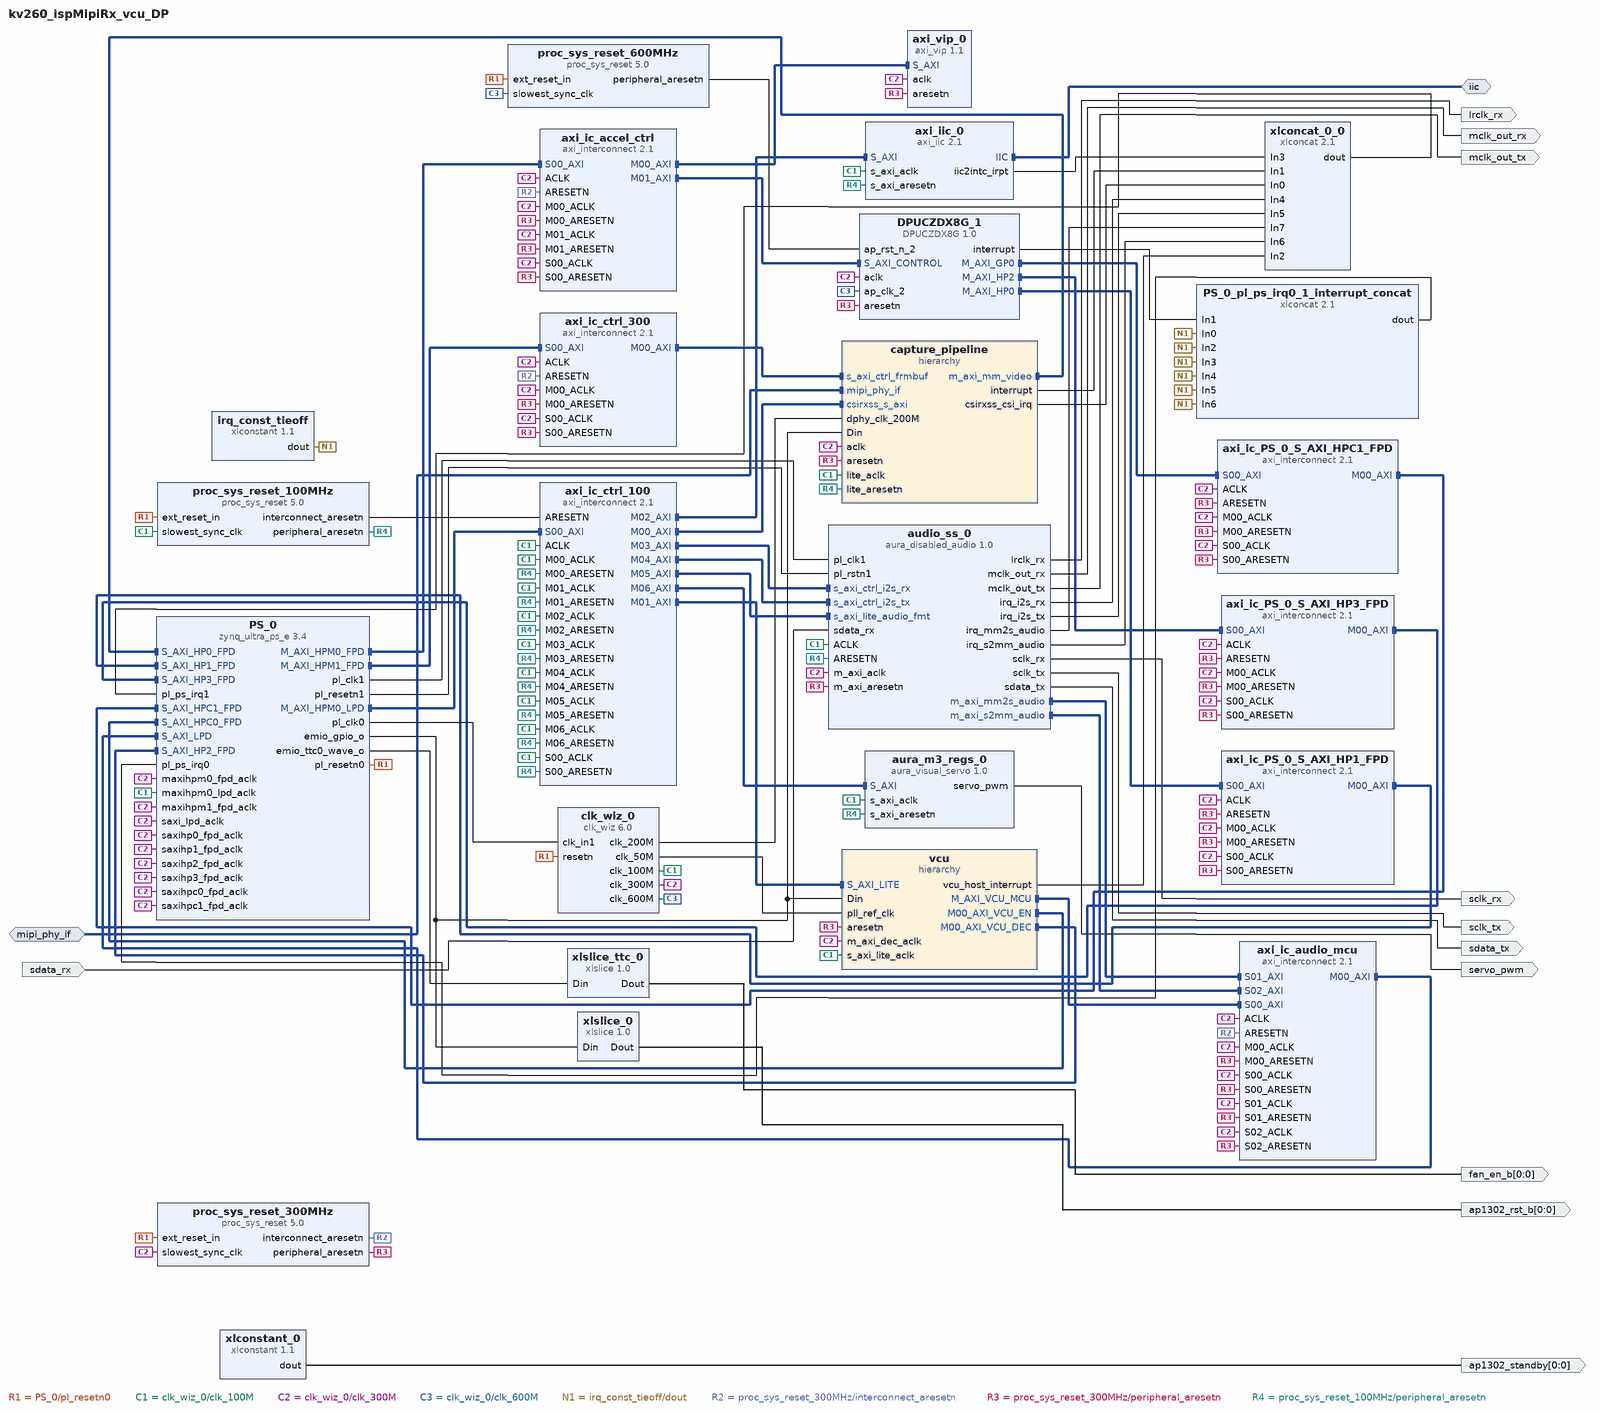
[diagram p0: block diagram of the top level]
# Vivado block design kv260_ispMipiRx_vcu_DP, xck26-sfvc784-2LV-c, Vivado 2022.2
create_bd_design kv260_ispMipiRx_vcu_DP

create_bd_intf_port -mode Master -vlnv xilinx.com:interface:iic_rtl:1.0 iic
create_bd_intf_port -mode Slave -vlnv xilinx.com:interface:mipi_phy_rtl:1.0 mipi_phy_if
create_bd_port -dir O -from 0 -to 0 ap1302_rst_b
create_bd_port -dir O -from 0 -to 0 ap1302_standby
create_bd_port -dir O -from 0 -to 0 fan_en_b
create_bd_port -dir O lrclk_rx
create_bd_port -dir O -type clk mclk_out_rx
create_bd_port -dir O -type clk mclk_out_tx
create_bd_port -dir O sclk_rx
create_bd_port -dir O sclk_tx
create_bd_port -dir I sdata_rx
create_bd_port -dir O sdata_tx
create_bd_port -dir O servo_pwm

create_bd_cell -type ip -vlnv xilinx.com:RTLKernel:DPUCZDX8G:1.0 DPUCZDX8G_1
create_bd_cell -type ip -vlnv xilinx.com:ip:zynq_ultra_ps_e:3.4 PS_0
set_property -dict [list \
  CONFIG.CAN0_BOARD_INTERFACE custom \
  CONFIG.CAN1_BOARD_INTERFACE custom \
  CONFIG.CSU_BOARD_INTERFACE custom \
  CONFIG.DP_BOARD_INTERFACE custom \
  CONFIG.GEM0_BOARD_INTERFACE custom \
  CONFIG.GEM1_BOARD_INTERFACE custom \
  CONFIG.GEM2_BOARD_INTERFACE custom \
  CONFIG.GEM3_BOARD_INTERFACE custom \
  CONFIG.GPIO_BOARD_INTERFACE custom \
  CONFIG.IIC0_BOARD_INTERFACE custom \
  CONFIG.IIC1_BOARD_INTERFACE custom \
  CONFIG.NAND_BOARD_INTERFACE custom \
  CONFIG.PCIE_BOARD_INTERFACE custom \
  CONFIG.PJTAG_BOARD_INTERFACE custom \
  CONFIG.PMU_BOARD_INTERFACE custom \
  CONFIG.PSU_BANK_0_IO_STANDARD LVCMOS18 \
  CONFIG.PSU_BANK_1_IO_STANDARD LVCMOS18 \
  CONFIG.PSU_BANK_2_IO_STANDARD LVCMOS18 \
  CONFIG.PSU_BANK_3_IO_STANDARD LVCMOS18 \
  CONFIG.PSU_USB3__DUAL_CLOCK_ENABLE 1 \
  CONFIG.PSU__CAN1__PERIPHERAL__ENABLE 0 \
  CONFIG.PSU__CRF_APB__ACPU_CTRL__FREQMHZ 1333.333 \
  CONFIG.PSU__CRF_APB__ACPU_CTRL__SRCSEL APLL \
  CONFIG.PSU__CRF_APB__APLL_CTRL__SRCSEL PSS_REF_CLK \
  CONFIG.PSU__CRF_APB__APLL_FRAC_CFG__ENABLED 1 \
  CONFIG.PSU__CRF_APB__DBG_FPD_CTRL__FREQMHZ 250 \
  CONFIG.PSU__CRF_APB__DBG_FPD_CTRL__SRCSEL IOPLL \
  CONFIG.PSU__CRF_APB__DBG_TRACE_CTRL__FREQMHZ 250 \
  CONFIG.PSU__CRF_APB__DBG_TRACE_CTRL__SRCSEL IOPLL \
  CONFIG.PSU__CRF_APB__DBG_TSTMP_CTRL__FREQMHZ 250 \
  CONFIG.PSU__CRF_APB__DBG_TSTMP_CTRL__SRCSEL IOPLL \
  CONFIG.PSU__CRF_APB__DDR_CTRL__FREQMHZ 1200 \
  CONFIG.PSU__CRF_APB__DDR_CTRL__SRCSEL DPLL \
  CONFIG.PSU__CRF_APB__DPDMA_REF_CTRL__FREQMHZ 600 \
  CONFIG.PSU__CRF_APB__DPDMA_REF_CTRL__SRCSEL APLL \
  CONFIG.PSU__CRF_APB__DPLL_CTRL__SRCSEL PSS_REF_CLK \
  CONFIG.PSU__CRF_APB__DP_AUDIO_REF_CTRL__SRCSEL RPLL \
  CONFIG.PSU__CRF_APB__DP_STC_REF_CTRL__SRCSEL RPLL \
  CONFIG.PSU__CRF_APB__DP_VIDEO_REF_CTRL__SRCSEL VPLL \
  CONFIG.PSU__CRF_APB__GDMA_REF_CTRL__FREQMHZ 600 \
  CONFIG.PSU__CRF_APB__GDMA_REF_CTRL__SRCSEL DPLL \
  CONFIG.PSU__CRF_APB__GPU_REF_CTRL__FREQMHZ 600 \
  CONFIG.PSU__CRF_APB__GPU_REF_CTRL__SRCSEL IOPLL \
  CONFIG.PSU__CRF_APB__TOPSW_LSBUS_CTRL__FREQMHZ 100 \
  CONFIG.PSU__CRF_APB__TOPSW_LSBUS_CTRL__SRCSEL IOPLL \
  CONFIG.PSU__CRF_APB__TOPSW_MAIN_CTRL__FREQMHZ 533.33 \
  CONFIG.PSU__CRF_APB__TOPSW_MAIN_CTRL__SRCSEL DPLL \
  CONFIG.PSU__CRF_APB__VPLL_CTRL__SRCSEL PSS_REF_CLK \
  CONFIG.PSU__CRL_APB__ADMA_REF_CTRL__FREQMHZ 500 \
  CONFIG.PSU__CRL_APB__ADMA_REF_CTRL__SRCSEL IOPLL \
  CONFIG.PSU__CRL_APB__CAN1_REF_CTRL__FREQMHZ 100 \
  CONFIG.PSU__CRL_APB__CAN1_REF_CTRL__SRCSEL IOPLL \
  CONFIG.PSU__CRL_APB__CPU_R5_CTRL__FREQMHZ 533.333 \
  CONFIG.PSU__CRL_APB__CPU_R5_CTRL__SRCSEL RPLL \
  CONFIG.PSU__CRL_APB__DBG_LPD_CTRL__FREQMHZ 250 \
  CONFIG.PSU__CRL_APB__DBG_LPD_CTRL__SRCSEL IOPLL \
  CONFIG.PSU__CRL_APB__GEM3_REF_CTRL__FREQMHZ 125 \
  CONFIG.PSU__CRL_APB__GEM3_REF_CTRL__SRCSEL IOPLL \
  CONFIG.PSU__CRL_APB__I2C0_REF_CTRL__FREQMHZ 100 \
  CONFIG.PSU__CRL_APB__I2C0_REF_CTRL__SRCSEL IOPLL \
  CONFIG.PSU__CRL_APB__I2C1_REF_CTRL__FREQMHZ 100 \
  CONFIG.PSU__CRL_APB__I2C1_REF_CTRL__SRCSEL IOPLL \
  CONFIG.PSU__CRL_APB__IOPLL_CTRL__SRCSEL PSS_REF_CLK \
  CONFIG.PSU__CRL_APB__IOU_SWITCH_CTRL__FREQMHZ 250 \
  CONFIG.PSU__CRL_APB__IOU_SWITCH_CTRL__SRCSEL IOPLL \
  CONFIG.PSU__CRL_APB__LPD_LSBUS_CTRL__FREQMHZ 100 \
  CONFIG.PSU__CRL_APB__LPD_LSBUS_CTRL__SRCSEL IOPLL \
  CONFIG.PSU__CRL_APB__LPD_SWITCH_CTRL__FREQMHZ 500 \
  CONFIG.PSU__CRL_APB__LPD_SWITCH_CTRL__SRCSEL IOPLL \
  CONFIG.PSU__CRL_APB__PCAP_CTRL__FREQMHZ 200 \
  CONFIG.PSU__CRL_APB__PCAP_CTRL__SRCSEL IOPLL \
  CONFIG.PSU__CRL_APB__PL0_REF_CTRL__FREQMHZ 100 \
  CONFIG.PSU__CRL_APB__PL0_REF_CTRL__SRCSEL IOPLL \
  CONFIG.PSU__CRL_APB__PL1_REF_CTRL__SRCSEL IOPLL \
  CONFIG.PSU__CRL_APB__QSPI_REF_CTRL__FREQMHZ 125 \
  CONFIG.PSU__CRL_APB__QSPI_REF_CTRL__SRCSEL IOPLL \
  CONFIG.PSU__CRL_APB__RPLL_CTRL__SRCSEL PSS_REF_CLK \
  CONFIG.PSU__CRL_APB__SDIO1_REF_CTRL__FREQMHZ 200 \
  CONFIG.PSU__CRL_APB__SDIO1_REF_CTRL__SRCSEL IOPLL \
  CONFIG.PSU__CRL_APB__SPI1_REF_CTRL__SRCSEL IOPLL \
  CONFIG.PSU__CRL_APB__TIMESTAMP_REF_CTRL__FREQMHZ 100 \
  CONFIG.PSU__CRL_APB__TIMESTAMP_REF_CTRL__SRCSEL IOPLL \
  CONFIG.PSU__CRL_APB__UART0_REF_CTRL__FREQMHZ 100 \
  CONFIG.PSU__CRL_APB__UART0_REF_CTRL__SRCSEL IOPLL \
  CONFIG.PSU__CRL_APB__UART1_REF_CTRL__FREQMHZ 100 \
  CONFIG.PSU__CRL_APB__UART1_REF_CTRL__SRCSEL IOPLL \
  CONFIG.PSU__CRL_APB__USB0_BUS_REF_CTRL__FREQMHZ 250 \
  CONFIG.PSU__CRL_APB__USB0_BUS_REF_CTRL__SRCSEL IOPLL \
  CONFIG.PSU__CRL_APB__USB3_DUAL_REF_CTRL__FREQMHZ 20 \
  CONFIG.PSU__CRL_APB__USB3_DUAL_REF_CTRL__SRCSEL IOPLL \
  CONFIG.PSU__CRL_APB__USB3__ENABLE 1 \
  CONFIG.PSU__CSUPMU__PERIPHERAL__VALID 1 \
  CONFIG.PSU__DDRC__BUS_WIDTH {64 Bit} \
  CONFIG.PSU__DDRC__COMPONENTS Components \
  CONFIG.PSU__DDRC__DEVICE_CAPACITY {8192 MBits} \
  CONFIG.PSU__DDRC__DRAM_WIDTH {16 Bits} \
  CONFIG.PSU__DDRC__ECC Disabled \
  CONFIG.PSU__DDRC__MEMORY_TYPE {DDR 4} \
  CONFIG.PSU__DDRC__SPEED_BIN DDR4_2400R \
  CONFIG.PSU__DDR_HIGH_ADDRESS_GUI_ENABLE 1 \
  CONFIG.PSU__DDR__INTERFACE__FREQMHZ 600.000 \
  CONFIG.PSU__DEVICE_TYPE EV \
  CONFIG.PSU__DISPLAYPORT__LANE0__ENABLE 1 \
  CONFIG.PSU__DISPLAYPORT__LANE0__IO {GT Lane1} \
  CONFIG.PSU__DISPLAYPORT__LANE1__ENABLE 1 \
  CONFIG.PSU__DISPLAYPORT__LANE1__IO {GT Lane0} \
  CONFIG.PSU__DISPLAYPORT__PERIPHERAL__ENABLE 1 \
  CONFIG.PSU__DLL__ISUSED 1 \
  CONFIG.PSU__DPAUX__PERIPHERAL__ENABLE 1 \
  CONFIG.PSU__DPAUX__PERIPHERAL__IO {MIO 27 .. 30} \
  CONFIG.PSU__DP__LANE_SEL {Dual Lower} \
  CONFIG.PSU__DP__REF_CLK_FREQ 27 \
  CONFIG.PSU__DP__REF_CLK_SEL {Ref Clk0} \
  CONFIG.PSU__ENET3__FIFO__ENABLE 0 \
  CONFIG.PSU__ENET3__GRP_MDIO__ENABLE 1 \
  CONFIG.PSU__ENET3__GRP_MDIO__IO {MIO 76 .. 77} \
  CONFIG.PSU__ENET3__PERIPHERAL__ENABLE 1 \
  CONFIG.PSU__ENET3__PERIPHERAL__IO {MIO 64 .. 75} \
  CONFIG.PSU__ENET3__PTP__ENABLE 0 \
  CONFIG.PSU__ENET3__TSU__ENABLE 0 \
  CONFIG.PSU__FPGA_PL0_ENABLE 1 \
  CONFIG.PSU__FPGA_PL1_ENABLE 1 \
  CONFIG.PSU__GEM3_COHERENCY 0 \
  CONFIG.PSU__GEM3_ROUTE_THROUGH_FPD 0 \
  CONFIG.PSU__GEM__TSU__ENABLE 0 \
  CONFIG.PSU__GPIO0_MIO__IO {MIO 0 .. 25} \
  CONFIG.PSU__GPIO0_MIO__PERIPHERAL__ENABLE 1 \
  CONFIG.PSU__GPIO1_MIO__IO {MIO 26 .. 51} \
  CONFIG.PSU__GPIO1_MIO__PERIPHERAL__ENABLE 1 \
  CONFIG.PSU__GPIO_EMIO_WIDTH 92 \
  CONFIG.PSU__GPIO_EMIO__PERIPHERAL__ENABLE 1 \
  CONFIG.PSU__GPIO_EMIO__PERIPHERAL__IO 92 \
  CONFIG.PSU__GPIO_EMIO__WIDTH {[93:0]} \
  CONFIG.PSU__GT__LINK_SPEED HBR \
  CONFIG.PSU__GT__PRE_EMPH_LVL_4 0 \
  CONFIG.PSU__GT__VLT_SWNG_LVL_4 0 \
  CONFIG.PSU__I2C0__PERIPHERAL__ENABLE 0 \
  CONFIG.PSU__I2C1__PERIPHERAL__ENABLE 1 \
  CONFIG.PSU__I2C1__PERIPHERAL__IO {MIO 24 .. 25} \
  CONFIG.PSU__IOU_SLCR__IOU_TTC_APB_CLK__TTC0_SEL APB \
  CONFIG.PSU__IOU_SLCR__IOU_TTC_APB_CLK__TTC1_SEL APB \
  CONFIG.PSU__IOU_SLCR__IOU_TTC_APB_CLK__TTC2_SEL APB \
  CONFIG.PSU__IOU_SLCR__IOU_TTC_APB_CLK__TTC3_SEL APB \
  CONFIG.PSU__MAXIGP0__DATA_WIDTH 32 \
  CONFIG.PSU__MAXIGP1__DATA_WIDTH 32 \
  CONFIG.PSU__NUM_FABRIC_RESETS 2 \
  CONFIG.PSU__OVERRIDE_HPX_QOS 0 \
  CONFIG.PSU__OVERRIDE__BASIC_CLOCK 0 \
  CONFIG.PSU__PMU_COHERENCY 0 \
  CONFIG.PSU__PMU__AIBACK__ENABLE 0 \
  CONFIG.PSU__PMU__EMIO_GPI__ENABLE 0 \
  CONFIG.PSU__PMU__EMIO_GPO__ENABLE 0 \
  CONFIG.PSU__PMU__GPI0__ENABLE 1 \
  CONFIG.PSU__PMU__GPI0__IO {MIO 26} \
  CONFIG.PSU__PMU__GPI1__ENABLE 0 \
  CONFIG.PSU__PMU__GPI2__ENABLE 0 \
  CONFIG.PSU__PMU__GPI3__ENABLE 0 \
  CONFIG.PSU__PMU__GPI4__ENABLE 0 \
  CONFIG.PSU__PMU__GPI5__ENABLE 1 \
  CONFIG.PSU__PMU__GPI5__IO {MIO 31} \
  CONFIG.PSU__PMU__GPO0__ENABLE 0 \
  CONFIG.PSU__PMU__GPO1__ENABLE 0 \
  CONFIG.PSU__PMU__GPO2__ENABLE 0 \
  CONFIG.PSU__PMU__GPO3__ENABLE 1 \
  CONFIG.PSU__PMU__GPO3__IO {MIO 35} \
  CONFIG.PSU__PMU__GPO3__POLARITY low \
  CONFIG.PSU__PMU__GPO4__ENABLE 0 \
  CONFIG.PSU__PMU__GPO5__ENABLE 0 \
  CONFIG.PSU__PMU__PERIPHERAL__ENABLE 1 \
  CONFIG.PSU__PMU__PLERROR__ENABLE 0 \
  CONFIG.PSU__PRESET_APPLIED 1 \
  CONFIG.PSU__PSS_REF_CLK__FREQMHZ 33.333 \
  CONFIG.PSU__QSPI_COHERENCY 0 \
  CONFIG.PSU__QSPI_ROUTE_THROUGH_FPD 0 \
  CONFIG.PSU__QSPI__GRP_FBCLK__ENABLE 0 \
  CONFIG.PSU__QSPI__PERIPHERAL__DATA_MODE x4 \
  CONFIG.PSU__QSPI__PERIPHERAL__ENABLE 1 \
  CONFIG.PSU__QSPI__PERIPHERAL__IO {MIO 0 .. 5} \
  CONFIG.PSU__QSPI__PERIPHERAL__MODE Single \
  CONFIG.PSU__SATA__PERIPHERAL__ENABLE 0 \
  CONFIG.PSU__SD0__CLK_100_SDR_OTAP_DLY 0x3 \
  CONFIG.PSU__SD0__CLK_200_SDR_OTAP_DLY 0x3 \
  CONFIG.PSU__SD0__CLK_50_DDR_ITAP_DLY 0x3D \
  CONFIG.PSU__SD0__CLK_50_DDR_OTAP_DLY 0x4 \
  CONFIG.PSU__SD0__CLK_50_SDR_ITAP_DLY 0x15 \
  CONFIG.PSU__SD0__CLK_50_SDR_OTAP_DLY 0x5 \
  CONFIG.PSU__SD1_COHERENCY 0 \
  CONFIG.PSU__SD1_ROUTE_THROUGH_FPD 0 \
  CONFIG.PSU__SD1__CLK_100_SDR_OTAP_DLY 0x3 \
  CONFIG.PSU__SD1__CLK_200_SDR_OTAP_DLY 0x3 \
  CONFIG.PSU__SD1__CLK_50_DDR_ITAP_DLY 0x3D \
  CONFIG.PSU__SD1__CLK_50_DDR_OTAP_DLY 0x4 \
  CONFIG.PSU__SD1__CLK_50_SDR_ITAP_DLY 0x15 \
  CONFIG.PSU__SD1__CLK_50_SDR_OTAP_DLY 0x5 \
  CONFIG.PSU__SD1__DATA_TRANSFER_MODE 8Bit \
  CONFIG.PSU__SD1__GRP_CD__ENABLE 1 \
  CONFIG.PSU__SD1__GRP_CD__IO {MIO 45} \
  CONFIG.PSU__SD1__GRP_POW__ENABLE 1 \
  CONFIG.PSU__SD1__GRP_POW__IO {MIO 43} \
  CONFIG.PSU__SD1__GRP_WP__ENABLE 0 \
  CONFIG.PSU__SD1__PERIPHERAL__ENABLE 1 \
  CONFIG.PSU__SD1__PERIPHERAL__IO {MIO 39 .. 51} \
  CONFIG.PSU__SD1__SLOT_TYPE {SD 3.0} \
  CONFIG.PSU__SPI1__GRP_SS0__IO {MIO 9} \
  CONFIG.PSU__SPI1__PERIPHERAL__ENABLE 1 \
  CONFIG.PSU__SPI1__PERIPHERAL__IO {MIO 6 .. 11} \
  CONFIG.PSU__SWDT0__CLOCK__ENABLE 0 \
  CONFIG.PSU__SWDT0__PERIPHERAL__ENABLE 1 \
  CONFIG.PSU__SWDT0__RESET__ENABLE 0 \
  CONFIG.PSU__SWDT1__CLOCK__ENABLE 0 \
  CONFIG.PSU__SWDT1__PERIPHERAL__ENABLE 1 \
  CONFIG.PSU__SWDT1__RESET__ENABLE 0 \
  CONFIG.PSU__TSU__BUFG_PORT_PAIR 0 \
  CONFIG.PSU__TTC0__CLOCK__ENABLE 0 \
  CONFIG.PSU__TTC0__PERIPHERAL__ENABLE 1 \
  CONFIG.PSU__TTC0__WAVEOUT__ENABLE 1 \
  CONFIG.PSU__TTC0__WAVEOUT__IO EMIO \
  CONFIG.PSU__TTC1__CLOCK__ENABLE 0 \
  CONFIG.PSU__TTC1__PERIPHERAL__ENABLE 1 \
  CONFIG.PSU__TTC1__WAVEOUT__ENABLE 0 \
  CONFIG.PSU__TTC2__CLOCK__ENABLE 0 \
  CONFIG.PSU__TTC2__PERIPHERAL__ENABLE 1 \
  CONFIG.PSU__TTC2__WAVEOUT__ENABLE 0 \
  CONFIG.PSU__TTC3__CLOCK__ENABLE 0 \
  CONFIG.PSU__TTC3__PERIPHERAL__ENABLE 1 \
  CONFIG.PSU__TTC3__WAVEOUT__ENABLE 0 \
  CONFIG.PSU__UART0__PERIPHERAL__ENABLE 0 \
  CONFIG.PSU__UART1__BAUD_RATE 115200 \
  CONFIG.PSU__UART1__MODEM__ENABLE 0 \
  CONFIG.PSU__UART1__PERIPHERAL__ENABLE 1 \
  CONFIG.PSU__UART1__PERIPHERAL__IO {MIO 36 .. 37} \
  CONFIG.PSU__USB0_COHERENCY 0 \
  CONFIG.PSU__USB0__PERIPHERAL__ENABLE 1 \
  CONFIG.PSU__USB0__PERIPHERAL__IO {MIO 52 .. 63} \
  CONFIG.PSU__USB0__REF_CLK_FREQ 26 \
  CONFIG.PSU__USB0__REF_CLK_SEL {Ref Clk1} \
  CONFIG.PSU__USB2_0__EMIO__ENABLE 0 \
  CONFIG.PSU__USB3_0__EMIO__ENABLE 0 \
  CONFIG.PSU__USB3_0__PERIPHERAL__ENABLE 1 \
  CONFIG.PSU__USB3_0__PERIPHERAL__IO {GT Lane2} \
  CONFIG.PSU__USB__RESET__MODE {Boot Pin} \
  CONFIG.PSU__USB__RESET__POLARITY {Active Low} \
  CONFIG.PSU__USE__IRQ0 1 \
  CONFIG.PSU__USE__IRQ1 1 \
  CONFIG.PSU__USE__M_AXI_GP0 1 \
  CONFIG.PSU__USE__M_AXI_GP1 1 \
  CONFIG.PSU__USE__M_AXI_GP2 1 \
  CONFIG.PSU__USE__S_AXI_GP0 1 \
  CONFIG.PSU__USE__S_AXI_GP1 1 \
  CONFIG.PSU__USE__S_AXI_GP2 1 \
  CONFIG.PSU__USE__S_AXI_GP3 1 \
  CONFIG.PSU__USE__S_AXI_GP4 1 \
  CONFIG.PSU__USE__S_AXI_GP5 1 \
  CONFIG.PSU__USE__S_AXI_GP6 1 \
  CONFIG.QSPI_BOARD_INTERFACE custom \
  CONFIG.SATA_BOARD_INTERFACE custom \
  CONFIG.SD0_BOARD_INTERFACE custom \
  CONFIG.SD1_BOARD_INTERFACE custom \
  CONFIG.SPI0_BOARD_INTERFACE custom \
  CONFIG.SPI1_BOARD_INTERFACE custom \
  CONFIG.SUBPRESET1 Custom \
  CONFIG.SUBPRESET2 Custom \
  CONFIG.SWDT0_BOARD_INTERFACE custom \
  CONFIG.SWDT1_BOARD_INTERFACE custom \
  CONFIG.TRACE_BOARD_INTERFACE custom \
  CONFIG.TTC0_BOARD_INTERFACE custom \
  CONFIG.TTC1_BOARD_INTERFACE custom \
  CONFIG.TTC2_BOARD_INTERFACE custom \
  CONFIG.TTC3_BOARD_INTERFACE custom \
  CONFIG.UART0_BOARD_INTERFACE custom \
  CONFIG.UART1_BOARD_INTERFACE custom \
  CONFIG.USB0_BOARD_INTERFACE custom \
  CONFIG.USB1_BOARD_INTERFACE custom \
  CONFIG.preset None \
] [get_bd_cells PS_0]
# 747 more settings of PS_0 are not shown: defaults, MIO pin electricals, DDR timing, and values the tool derives
create_bd_cell -type ip -vlnv xilinx.com:ip:xlconcat:2.1 PS_0_pl_ps_irq0_1_interrupt_concat
set_property -dict {CONFIG.NUM_PORTS 7} [get_bd_cells PS_0_pl_ps_irq0_1_interrupt_concat]
create_bd_cell -type ip -vlnv aura.local:user:aura_disabled_audio:1.0 audio_ss_0
create_bd_cell -type ip -vlnv aura.local:user:aura_visual_servo:1.0 aura_m3_regs_0
set_property -dict {CONFIG.BUILD_ID 0x10282601} [get_bd_cells aura_m3_regs_0]
create_bd_cell -type ip -vlnv xilinx.com:ip:axi_interconnect:2.1 axi_ic_PS_0_S_AXI_HP1_FPD
set_property -dict [list \
  CONFIG.M00_HAS_REGSLICE 0 \
  CONFIG.NUM_MI 1 \
  CONFIG.NUM_SI 1 \
  CONFIG.S00_HAS_REGSLICE 0 \
] [get_bd_cells axi_ic_PS_0_S_AXI_HP1_FPD]
create_bd_cell -type ip -vlnv xilinx.com:ip:axi_interconnect:2.1 axi_ic_PS_0_S_AXI_HP3_FPD
set_property -dict [list \
  CONFIG.M00_HAS_REGSLICE 0 \
  CONFIG.NUM_MI 1 \
  CONFIG.NUM_SI 1 \
  CONFIG.S00_HAS_REGSLICE 0 \
] [get_bd_cells axi_ic_PS_0_S_AXI_HP3_FPD]
create_bd_cell -type ip -vlnv xilinx.com:ip:axi_interconnect:2.1 axi_ic_PS_0_S_AXI_HPC1_FPD
set_property -dict [list \
  CONFIG.M00_HAS_REGSLICE 0 \
  CONFIG.NUM_MI 1 \
  CONFIG.NUM_SI 1 \
  CONFIG.S00_HAS_REGSLICE 0 \
] [get_bd_cells axi_ic_PS_0_S_AXI_HPC1_FPD]
create_bd_cell -type ip -vlnv xilinx.com:ip:axi_interconnect:2.1 axi_ic_accel_ctrl
set_property -dict [list \
  CONFIG.M01_HAS_REGSLICE 1 \
  CONFIG.NUM_MI 2 \
  CONFIG.NUM_SI 1 \
  CONFIG.S00_HAS_REGSLICE 1 \
] [get_bd_cells axi_ic_accel_ctrl]
create_bd_cell -type ip -vlnv xilinx.com:ip:axi_interconnect:2.1 axi_ic_audio_mcu
set_property -dict [list \
  CONFIG.M00_HAS_REGSLICE 1 \
  CONFIG.NUM_MI 1 \
  CONFIG.NUM_SI 3 \
  CONFIG.S00_HAS_REGSLICE 1 \
  CONFIG.S01_HAS_REGSLICE 1 \
  CONFIG.S02_HAS_DATA_FIFO 0 \
  CONFIG.S02_HAS_REGSLICE 1 \
] [get_bd_cells axi_ic_audio_mcu]
create_bd_cell -type ip -vlnv xilinx.com:ip:axi_interconnect:2.1 axi_ic_ctrl_100
set_property -dict {CONFIG.ENABLE_ADVANCED_OPTIONS 1 CONFIG.NUM_MI 7 CONFIG.S00_HAS_REGSLICE 1} [get_bd_cells axi_ic_ctrl_100]
create_bd_cell -type ip -vlnv xilinx.com:ip:axi_interconnect:2.1 axi_ic_ctrl_300
set_property -dict {CONFIG.NUM_MI 1} [get_bd_cells axi_ic_ctrl_300]
create_bd_cell -type ip -vlnv xilinx.com:ip:axi_iic:2.1 axi_iic_0
set_property -dict {CONFIG.IIC_FREQ_KHZ 400} [get_bd_cells axi_iic_0]
create_bd_cell -type ip -vlnv xilinx.com:ip:axi_vip:1.1 axi_vip_0
set_property -dict {CONFIG.INTERFACE_MODE SLAVE} [get_bd_cells axi_vip_0]
create_bd_cell -type hier capture_pipeline
create_bd_cell -type ip -vlnv xilinx.com:ip:clk_wiz:6.0 clk_wiz_0
set_property -dict [list \
  CONFIG.CLKOUT1_JITTER 102.087 \
  CONFIG.CLKOUT1_PHASE_ERROR 87.181 \
  CONFIG.CLKOUT1_REQUESTED_OUT_FREQ 200.000 \
  CONFIG.CLKOUT2_JITTER 115.833 \
  CONFIG.CLKOUT2_PHASE_ERROR 87.181 \
  CONFIG.CLKOUT2_USED true \
  CONFIG.CLKOUT3_JITTER 94.863 \
  CONFIG.CLKOUT3_PHASE_ERROR 87.181 \
  CONFIG.CLKOUT3_REQUESTED_OUT_FREQ 300.000 \
  CONFIG.CLKOUT3_USED true \
  CONFIG.CLKOUT4_JITTER 132.685 \
  CONFIG.CLKOUT4_PHASE_ERROR 87.181 \
  CONFIG.CLKOUT4_REQUESTED_OUT_FREQ 50.000 \
  CONFIG.CLKOUT4_USED true \
  CONFIG.CLKOUT5_JITTER 83.769 \
  CONFIG.CLKOUT5_PHASE_ERROR 87.181 \
  CONFIG.CLKOUT5_REQUESTED_OUT_FREQ 600.000 \
  CONFIG.CLKOUT5_USED true \
  CONFIG.CLK_OUT1_PORT clk_200M \
  CONFIG.CLK_OUT2_PORT clk_100M \
  CONFIG.CLK_OUT3_PORT clk_300M \
  CONFIG.CLK_OUT4_PORT clk_50M \
  CONFIG.CLK_OUT5_PORT clk_600M \
  CONFIG.MMCM_CLKOUT0_DIVIDE_F 6.000 \
  CONFIG.MMCM_CLKOUT1_DIVIDE 12 \
  CONFIG.MMCM_CLKOUT2_DIVIDE 4 \
  CONFIG.MMCM_CLKOUT3_DIVIDE 24 \
  CONFIG.MMCM_CLKOUT4_DIVIDE 2 \
  CONFIG.MMCM_DIVCLK_DIVIDE 1 \
  CONFIG.NUM_OUT_CLKS 5 \
  CONFIG.PRIM_SOURCE Global_buffer \
  CONFIG.RESET_PORT resetn \
  CONFIG.RESET_TYPE ACTIVE_LOW \
] [get_bd_cells clk_wiz_0]
create_bd_cell -type ip -vlnv xilinx.com:ip:xlconstant:1.1 irq_const_tieoff
set_property -dict {CONFIG.CONST_VAL 0 CONFIG.CONST_WIDTH 1} [get_bd_cells irq_const_tieoff]
create_bd_cell -type ip -vlnv xilinx.com:ip:proc_sys_reset:5.0 proc_sys_reset_100MHz
create_bd_cell -type ip -vlnv xilinx.com:ip:proc_sys_reset:5.0 proc_sys_reset_300MHz
create_bd_cell -type ip -vlnv xilinx.com:ip:proc_sys_reset:5.0 proc_sys_reset_600MHz
create_bd_cell -type hier vcu
create_bd_cell -type ip -vlnv xilinx.com:ip:xlconcat:2.1 xlconcat_0_0
set_property -dict {CONFIG.NUM_PORTS 8} [get_bd_cells xlconcat_0_0]
create_bd_cell -type ip -vlnv xilinx.com:ip:xlconstant:1.1 xlconstant_0
set_property -dict {CONFIG.CONST_VAL 0} [get_bd_cells xlconstant_0]
create_bd_cell -type ip -vlnv xilinx.com:ip:xlslice:1.0 xlslice_0
set_property -dict {CONFIG.DIN_FROM 1 CONFIG.DIN_TO 1 CONFIG.DIN_WIDTH 92 CONFIG.DOUT_WIDTH 1} [get_bd_cells xlslice_0]
create_bd_cell -type ip -vlnv xilinx.com:ip:xlslice:1.0 xlslice_ttc_0
set_property -dict {CONFIG.DIN_FROM 2 CONFIG.DIN_TO 2 CONFIG.DIN_WIDTH 3 CONFIG.DOUT_WIDTH 1} [get_bd_cells xlslice_ttc_0]

# ---- hierarchy /capture_pipeline ----
current_bd_instance /capture_pipeline
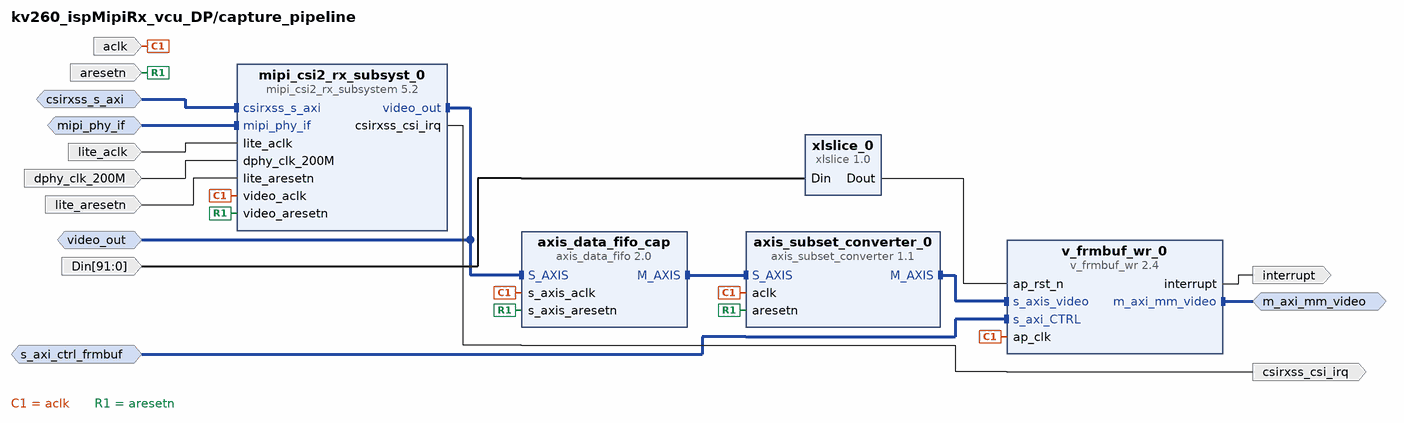
[diagram p1: block diagram inside /capture_pipeline]
create_bd_intf_pin -mode Slave -vlnv xilinx.com:interface:aximm_rtl:1.0 csirxss_s_axi
create_bd_intf_pin -mode Master -vlnv xilinx.com:interface:aximm_rtl:1.0 m_axi_mm_video
create_bd_intf_pin -mode Slave -vlnv xilinx.com:interface:mipi_phy_rtl:1.0 mipi_phy_if
create_bd_intf_pin -mode Slave -vlnv xilinx.com:interface:aximm_rtl:1.0 s_axi_ctrl_frmbuf
create_bd_intf_pin -mode Monitor -vlnv xilinx.com:interface:axis_rtl:1.0 video_out
create_bd_pin -dir I -from 91 -to 0 Din
create_bd_pin -dir I -type clk aclk
create_bd_pin -dir I -type rst aresetn
create_bd_pin -dir O -type intr csirxss_csi_irq
create_bd_pin -dir I -type clk dphy_clk_200M
create_bd_pin -dir O -type intr interrupt
create_bd_pin -dir I -type clk lite_aclk
create_bd_pin -dir I -type rst lite_aresetn

create_bd_cell -type ip -vlnv xilinx.com:ip:axis_data_fifo:2.0 axis_data_fifo_cap
set_property -dict {CONFIG.FIFO_DEPTH 1024} [get_bd_cells axis_data_fifo_cap]
create_bd_cell -type ip -vlnv xilinx.com:ip:axis_subset_converter:1.1 axis_subset_converter_0
set_property -dict [list \
  CONFIG.M_TDATA_NUM_BYTES 6 \
  CONFIG.M_TDEST_WIDTH 1 \
  CONFIG.S_TDATA_NUM_BYTES 4 \
  CONFIG.S_TDEST_WIDTH 10 \
  CONFIG.TDATA_REMAP {16'b00000000,tdata[31:0]} \
  CONFIG.TDEST_REMAP {tdest[0:0]} \
] [get_bd_cells axis_subset_converter_0]
create_bd_cell -type ip -vlnv xilinx.com:ip:mipi_csi2_rx_subsystem:5.2 mipi_csi2_rx_subsyst_0
set_property -dict [list \
  CONFIG.CMN_NUM_PIXELS 2 \
  CONFIG.CMN_VC 0 \
  CONFIG.CSI_BUF_DEPTH 4096 \
  CONFIG.C_CSI_FILTER_USERDATATYPE true \
  CONFIG.C_HS_LINE_RATE 896 \
  CONFIG.C_HS_SETTLE_NS 146 \
  CONFIG.DPHYRX_BOARD_INTERFACE som240_1_connector_mipi_csi_isp \
  CONFIG.DPY_LINE_RATE 896 \
  CONFIG.SupportLevel 1 \
] [get_bd_cells mipi_csi2_rx_subsyst_0]
create_bd_cell -type ip -vlnv xilinx.com:ip:v_frmbuf_wr:2.4 v_frmbuf_wr_0
set_property -dict [list \
  CONFIG.AXIMM_DATA_WIDTH 128 \
  CONFIG.C_M_AXI_MM_VIDEO_DATA_WIDTH 128 \
  CONFIG.HAS_BGR8 0 \
  CONFIG.HAS_BGRX8 0 \
  CONFIG.HAS_RGB8 0 \
  CONFIG.HAS_UYVY8 0 \
  CONFIG.HAS_YUV8 0 \
  CONFIG.HAS_Y_UV8 0 \
  CONFIG.HAS_Y_UV8_420 1 \
  CONFIG.MAX_COLS 3840 \
  CONFIG.MAX_NR_PLANES 2 \
  CONFIG.MAX_ROWS 2160 \
  CONFIG.SAMPLES_PER_CLOCK 2 \
] [get_bd_cells v_frmbuf_wr_0]
create_bd_cell -type ip -vlnv xilinx.com:ip:xlslice:1.0 xlslice_0
set_property -dict {CONFIG.DIN_FROM 0 CONFIG.DIN_TO 0 CONFIG.DIN_WIDTH 92 CONFIG.DOUT_WIDTH 1} [get_bd_cells xlslice_0]

# ---- hierarchy /vcu ----
current_bd_instance /vcu
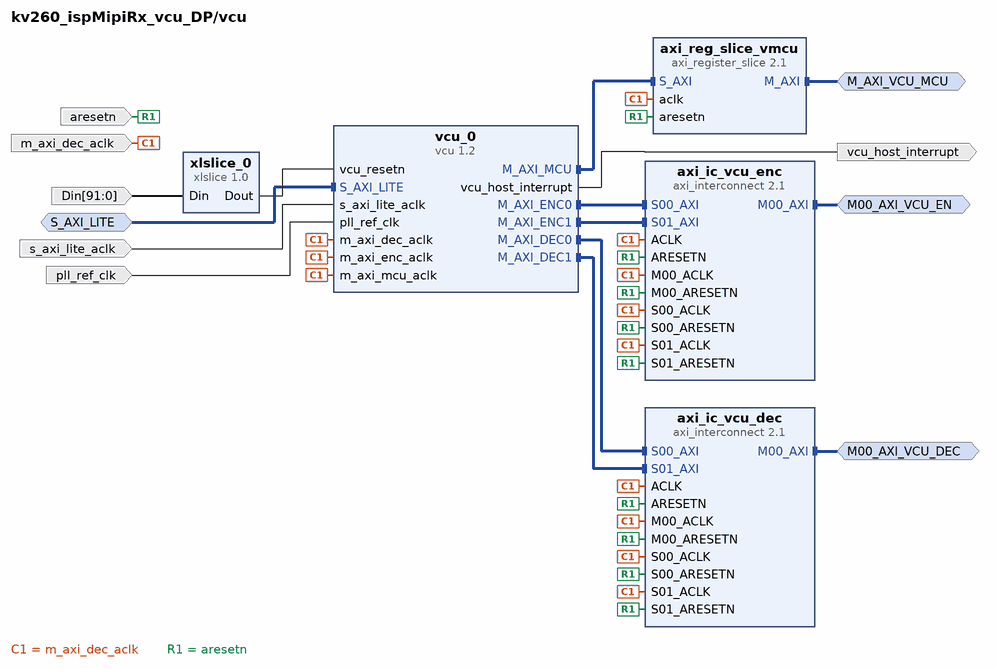
[diagram p2: block diagram inside /vcu]
create_bd_intf_pin -mode Master -vlnv xilinx.com:interface:aximm_rtl:1.0 M00_AXI_VCU_DEC
create_bd_intf_pin -mode Master -vlnv xilinx.com:interface:aximm_rtl:1.0 M00_AXI_VCU_EN
create_bd_intf_pin -mode Master -vlnv xilinx.com:interface:aximm_rtl:1.0 M_AXI_VCU_MCU
create_bd_intf_pin -mode Slave -vlnv xilinx.com:interface:aximm_rtl:1.0 S_AXI_LITE
create_bd_pin -dir I -from 91 -to 0 Din
create_bd_pin -dir I -type rst aresetn
create_bd_pin -dir I -type clk m_axi_dec_aclk
create_bd_pin -dir I -type clk pll_ref_clk
create_bd_pin -dir I -type clk s_axi_lite_aclk
create_bd_pin -dir O -type intr vcu_host_interrupt

create_bd_cell -type ip -vlnv xilinx.com:ip:axi_interconnect:2.1 axi_ic_vcu_dec
set_property -dict [list \
  CONFIG.M00_HAS_REGSLICE 1 \
  CONFIG.NUM_MI 1 \
  CONFIG.NUM_SI 2 \
  CONFIG.S00_HAS_REGSLICE 1 \
  CONFIG.S01_HAS_REGSLICE 1 \
] [get_bd_cells axi_ic_vcu_dec]
create_bd_cell -type ip -vlnv xilinx.com:ip:axi_interconnect:2.1 axi_ic_vcu_enc
set_property -dict [list \
  CONFIG.M00_HAS_REGSLICE 1 \
  CONFIG.NUM_MI 1 \
  CONFIG.NUM_SI 2 \
  CONFIG.S00_HAS_REGSLICE 1 \
  CONFIG.S01_HAS_REGSLICE 1 \
] [get_bd_cells axi_ic_vcu_enc]
create_bd_cell -type ip -vlnv xilinx.com:ip:axi_register_slice:2.1 axi_reg_slice_vmcu
create_bd_cell -type ip -vlnv xilinx.com:ip:vcu:1.2 vcu_0
set_property -dict [list \
  CONFIG.DEC_CODING_TYPE 0 \
  CONFIG.DEC_COLOR_DEPTH 0 \
  CONFIG.DEC_COLOR_FORMAT 0 \
  CONFIG.DEC_FPS 1 \
  CONFIG.DEC_FRAME_SIZE 4 \
  CONFIG.ENABLE_DECODER true \
  CONFIG.ENC_BUFFER_EN true \
  CONFIG.ENC_BUFFER_MANUAL_OVERRIDE 1 \
  CONFIG.ENC_BUFFER_SIZE 253 \
  CONFIG.ENC_BUFFER_SIZE_ACTUAL 284 \
  CONFIG.ENC_BUFFER_TYPE 0 \
  CONFIG.ENC_CODING_TYPE 1 \
  CONFIG.ENC_COLOR_DEPTH 0 \
  CONFIG.ENC_COLOR_FORMAT 0 \
  CONFIG.ENC_FPS 1 \
  CONFIG.ENC_FRAME_SIZE 4 \
  CONFIG.ENC_MEM_BRAM_USED 0 \
  CONFIG.ENC_MEM_URAM_USED 284 \
  CONFIG.NO_OF_DEC_STREAMS 1 \
  CONFIG.NO_OF_STREAMS 1 \
  CONFIG.TABLE_NO 2 \
] [get_bd_cells vcu_0]
create_bd_cell -type ip -vlnv xilinx.com:ip:xlslice:1.0 xlslice_0
set_property -dict {CONFIG.DIN_FROM 2 CONFIG.DIN_TO 2 CONFIG.DIN_WIDTH 92 CONFIG.DOUT_WIDTH 1} [get_bd_cells xlslice_0]

# ---- connections ----

current_bd_instance /capture_pipeline
connect_bd_intf_net -intf_net axi_interconnect_0_M00_AXI [get_bd_intf_pins csirxss_s_axi] [get_bd_intf_pins mipi_csi2_rx_subsyst_0/csirxss_s_axi]
connect_bd_intf_net -intf_net axi_interconnect_0_M11_AXI [get_bd_intf_pins s_axi_ctrl_frmbuf] [get_bd_intf_pins v_frmbuf_wr_0/s_axi_CTRL]
connect_bd_intf_net [get_bd_intf_pins axis_data_fifo_cap/M_AXIS] [get_bd_intf_pins axis_subset_converter_0/S_AXIS]
connect_bd_intf_net [get_bd_intf_pins axis_subset_converter_0/M_AXIS] [get_bd_intf_pins v_frmbuf_wr_0/s_axis_video]
connect_bd_intf_net [get_bd_intf_pins axis_data_fifo_cap/S_AXIS] [get_bd_intf_pins mipi_csi2_rx_subsyst_0/video_out]
connect_bd_intf_net [get_bd_intf_pins axis_data_fifo_cap/S_AXIS] [get_bd_intf_pins video_out]
connect_bd_intf_net [get_bd_intf_pins mipi_phy_if] [get_bd_intf_pins mipi_csi2_rx_subsyst_0/mipi_phy_if]
connect_bd_intf_net -intf_net v_frmbuf_wr_1_m_axi_mm_video [get_bd_intf_pins m_axi_mm_video] [get_bd_intf_pins v_frmbuf_wr_0/m_axi_mm_video]
connect_bd_net [get_bd_pins Din] [get_bd_pins xlslice_0/Din]
connect_bd_net -net clk_wiz_0_clk_100M [get_bd_pins lite_aclk] [get_bd_pins mipi_csi2_rx_subsyst_0/lite_aclk]
connect_bd_net -net clk_wiz_0_clk_200M [get_bd_pins dphy_clk_200M] [get_bd_pins mipi_csi2_rx_subsyst_0/dphy_clk_200M]
connect_bd_net -net clk_wiz_0_clk_300M [get_bd_pins aclk] \
  [get_bd_pins axis_data_fifo_cap/s_axis_aclk] [get_bd_pins axis_subset_converter_0/aclk] \
  [get_bd_pins mipi_csi2_rx_subsyst_0/video_aclk] [get_bd_pins v_frmbuf_wr_0/ap_clk]
connect_bd_net [get_bd_pins mipi_csi2_rx_subsyst_0/csirxss_csi_irq] [get_bd_pins csirxss_csi_irq]
connect_bd_net -net proc_sys_reset_1_peripheral_aresetn [get_bd_pins aresetn] \
  [get_bd_pins axis_data_fifo_cap/s_axis_aresetn] [get_bd_pins axis_subset_converter_0/aresetn] \
  [get_bd_pins mipi_csi2_rx_subsyst_0/video_aresetn]
connect_bd_net -net proc_sys_reset_2_peripheral_aresetn [get_bd_pins lite_aresetn] [get_bd_pins mipi_csi2_rx_subsyst_0/lite_aresetn]
connect_bd_net -net v_frmbuf_wr_1_interrupt [get_bd_pins v_frmbuf_wr_0/interrupt] [get_bd_pins interrupt]
connect_bd_net -net xlslice_2_Dout [get_bd_pins xlslice_0/Dout] [get_bd_pins v_frmbuf_wr_0/ap_rst_n]

current_bd_instance /vcu
connect_bd_intf_net [get_bd_intf_pins axi_ic_vcu_enc/S00_AXI] [get_bd_intf_pins vcu_0/M_AXI_ENC0]
connect_bd_intf_net [get_bd_intf_pins axi_ic_vcu_dec/S00_AXI] [get_bd_intf_pins vcu_0/M_AXI_DEC0]
connect_bd_intf_net [get_bd_intf_pins axi_ic_vcu_enc/S01_AXI] [get_bd_intf_pins vcu_0/M_AXI_ENC1]
connect_bd_intf_net [get_bd_intf_pins axi_ic_vcu_dec/S01_AXI] [get_bd_intf_pins vcu_0/M_AXI_DEC1]
connect_bd_intf_net [get_bd_intf_pins M00_AXI_VCU_DEC] [get_bd_intf_pins axi_ic_vcu_dec/M00_AXI]
connect_bd_intf_net [get_bd_intf_pins M00_AXI_VCU_EN] [get_bd_intf_pins axi_ic_vcu_enc/M00_AXI]
connect_bd_intf_net -intf_net axi_register_slice_0_M_AXI [get_bd_intf_pins M_AXI_VCU_MCU] [get_bd_intf_pins axi_reg_slice_vmcu/M_AXI]
connect_bd_intf_net -intf_net smartconnect_0_M02_AXI [get_bd_intf_pins S_AXI_LITE] [get_bd_intf_pins vcu_0/S_AXI_LITE]
connect_bd_intf_net [get_bd_intf_pins axi_reg_slice_vmcu/S_AXI] [get_bd_intf_pins vcu_0/M_AXI_MCU]
connect_bd_net [get_bd_pins Din] [get_bd_pins xlslice_0/Din]
connect_bd_net -net clk_wiz_0_clk_100M [get_bd_pins s_axi_lite_aclk] [get_bd_pins vcu_0/s_axi_lite_aclk]
connect_bd_net -net clk_wiz_0_clk_300M [get_bd_pins m_axi_dec_aclk] \
  [get_bd_pins axi_ic_vcu_dec/ACLK] [get_bd_pins axi_ic_vcu_dec/M00_ACLK] [get_bd_pins axi_ic_vcu_dec/S00_ACLK] \
  [get_bd_pins axi_ic_vcu_dec/S01_ACLK] [get_bd_pins axi_ic_vcu_enc/ACLK] [get_bd_pins axi_ic_vcu_enc/M00_ACLK] \
  [get_bd_pins axi_ic_vcu_enc/S00_ACLK] [get_bd_pins axi_ic_vcu_enc/S01_ACLK] [get_bd_pins axi_reg_slice_vmcu/aclk] \
  [get_bd_pins vcu_0/m_axi_dec_aclk] [get_bd_pins vcu_0/m_axi_enc_aclk] [get_bd_pins vcu_0/m_axi_mcu_aclk]
connect_bd_net -net clk_wiz_0_clk_50M [get_bd_pins pll_ref_clk] [get_bd_pins vcu_0/pll_ref_clk]
connect_bd_net -net proc_sys_reset_1_peripheral_aresetn [get_bd_pins aresetn] \
  [get_bd_pins axi_ic_vcu_dec/ARESETN] [get_bd_pins axi_ic_vcu_dec/M00_ARESETN] [get_bd_pins axi_ic_vcu_dec/S00_ARESETN] \
  [get_bd_pins axi_ic_vcu_dec/S01_ARESETN] [get_bd_pins axi_ic_vcu_enc/ARESETN] [get_bd_pins axi_ic_vcu_enc/M00_ARESETN] \
  [get_bd_pins axi_ic_vcu_enc/S00_ARESETN] [get_bd_pins axi_ic_vcu_enc/S01_ARESETN] [get_bd_pins axi_reg_slice_vmcu/aresetn]
connect_bd_net [get_bd_pins vcu_0/vcu_host_interrupt] [get_bd_pins vcu_host_interrupt]
connect_bd_net [get_bd_pins xlslice_0/Dout] [get_bd_pins vcu_0/vcu_resetn]

current_bd_instance /
connect_bd_intf_net [get_bd_intf_pins DPUCZDX8G_1/M_AXI_GP0] [get_bd_intf_pins axi_ic_PS_0_S_AXI_HPC1_FPD/S00_AXI]
connect_bd_intf_net [get_bd_intf_pins DPUCZDX8G_1/M_AXI_HP0] [get_bd_intf_pins axi_ic_PS_0_S_AXI_HP1_FPD/S00_AXI]
connect_bd_intf_net [get_bd_intf_pins DPUCZDX8G_1/M_AXI_HP2] [get_bd_intf_pins axi_ic_PS_0_S_AXI_HP3_FPD/S00_AXI]
connect_bd_intf_net [get_bd_intf_pins PS_0/M_AXI_HPM0_FPD] [get_bd_intf_pins axi_ic_accel_ctrl/S00_AXI]
connect_bd_intf_net [get_bd_intf_pins PS_0/M_AXI_HPM1_FPD] [get_bd_intf_pins axi_ic_ctrl_300/S00_AXI]
connect_bd_intf_net [get_bd_intf_pins PS_0/M_AXI_HPM0_LPD] [get_bd_intf_pins axi_ic_ctrl_100/S00_AXI]
connect_bd_intf_net [get_bd_intf_pins audio_ss_0/m_axi_mm2s_audio] [get_bd_intf_pins axi_ic_audio_mcu/S01_AXI]
connect_bd_intf_net [get_bd_intf_pins audio_ss_0/m_axi_s2mm_audio] [get_bd_intf_pins axi_ic_audio_mcu/S02_AXI]
connect_bd_intf_net [get_bd_intf_pins PS_0/S_AXI_HP1_FPD] [get_bd_intf_pins axi_ic_PS_0_S_AXI_HP1_FPD/M00_AXI]
connect_bd_intf_net [get_bd_intf_pins PS_0/S_AXI_HP3_FPD] [get_bd_intf_pins axi_ic_PS_0_S_AXI_HP3_FPD/M00_AXI]
connect_bd_intf_net [get_bd_intf_pins PS_0/S_AXI_HPC1_FPD] [get_bd_intf_pins axi_ic_PS_0_S_AXI_HPC1_FPD/M00_AXI]
connect_bd_intf_net [get_bd_intf_pins axi_ic_accel_ctrl/M00_AXI] [get_bd_intf_pins axi_vip_0/S_AXI]
connect_bd_intf_net [get_bd_intf_pins DPUCZDX8G_1/S_AXI_CONTROL] [get_bd_intf_pins axi_ic_accel_ctrl/M01_AXI]
connect_bd_intf_net -intf_net axi_ic_cap_audio_M00_AXI [get_bd_intf_pins PS_0/S_AXI_LPD] [get_bd_intf_pins axi_ic_audio_mcu/M00_AXI]
connect_bd_intf_net [get_bd_intf_pins axi_ic_ctrl_100/M02_AXI] [get_bd_intf_pins axi_iic_0/S_AXI]
connect_bd_intf_net [get_bd_intf_pins aura_m3_regs_0/S_AXI] [get_bd_intf_pins axi_ic_ctrl_100/M06_AXI]
connect_bd_intf_net [get_bd_intf_ports iic] [get_bd_intf_pins axi_iic_0/IIC]
connect_bd_intf_net -intf_net axi_interconnect_0_M00_AXI [get_bd_intf_pins axi_ic_ctrl_100/M00_AXI] [get_bd_intf_pins capture_pipeline/csirxss_s_axi]
connect_bd_intf_net -intf_net axi_interconnect_0_M00_AXI1 [get_bd_intf_pins axi_ic_ctrl_300/M00_AXI] [get_bd_intf_pins capture_pipeline/s_axi_ctrl_frmbuf]
connect_bd_intf_net -intf_net axi_interconnect_0_M03_AXI [get_bd_intf_pins audio_ss_0/s_axi_ctrl_i2s_rx] [get_bd_intf_pins axi_ic_ctrl_100/M03_AXI]
connect_bd_intf_net -intf_net axi_interconnect_0_M04_AXI [get_bd_intf_pins audio_ss_0/s_axi_ctrl_i2s_tx] [get_bd_intf_pins axi_ic_ctrl_100/M04_AXI]
connect_bd_intf_net -intf_net axi_interconnect_0_M05_AXI [get_bd_intf_pins audio_ss_0/s_axi_lite_audio_fmt] [get_bd_intf_pins axi_ic_ctrl_100/M05_AXI]
connect_bd_intf_net -intf_net axi_interconnect_ctrl_100_M01_AXI [get_bd_intf_pins axi_ic_ctrl_100/M01_AXI] [get_bd_intf_pins vcu/S_AXI_LITE]
connect_bd_intf_net [get_bd_intf_pins PS_0/S_AXI_HP0_FPD] [get_bd_intf_pins capture_pipeline/m_axi_mm_video]
connect_bd_intf_net [get_bd_intf_ports mipi_phy_if] [get_bd_intf_pins capture_pipeline/mipi_phy_if]
connect_bd_intf_net -intf_net vcu_M00_AXI_VCU_DEC [get_bd_intf_pins PS_0/S_AXI_HPC0_FPD] [get_bd_intf_pins vcu/M00_AXI_VCU_EN]
connect_bd_intf_net -intf_net vcu_M00_AXI_VCU_EN [get_bd_intf_pins PS_0/S_AXI_HP2_FPD] [get_bd_intf_pins vcu/M00_AXI_VCU_DEC]
connect_bd_intf_net [get_bd_intf_pins axi_ic_audio_mcu/S00_AXI] [get_bd_intf_pins vcu/M_AXI_VCU_MCU]
connect_bd_net -net ARESETN_1 [get_bd_pins proc_sys_reset_100MHz/interconnect_aresetn] [get_bd_pins axi_ic_ctrl_100/ARESETN]
connect_bd_net [get_bd_pins DPUCZDX8G_1/interrupt] [get_bd_pins PS_0_pl_ps_irq0_1_interrupt_concat/In1]
connect_bd_net [get_bd_pins PS_0/emio_gpio_o] [get_bd_pins capture_pipeline/Din] [get_bd_pins vcu/Din] [get_bd_pins xlslice_0/Din]
connect_bd_net [get_bd_pins PS_0/pl_clk0] [get_bd_pins clk_wiz_0/clk_in1]
connect_bd_net [get_bd_pins PS_0/pl_clk1] [get_bd_pins audio_ss_0/pl_clk1]
connect_bd_net [get_bd_pins PS_0_pl_ps_irq0_1_interrupt_concat/dout] [get_bd_pins PS_0/pl_ps_irq0]
connect_bd_net [get_bd_pins PS_0/pl_resetn0] \
  [get_bd_pins clk_wiz_0/resetn] [get_bd_pins proc_sys_reset_100MHz/ext_reset_in] \
  [get_bd_pins proc_sys_reset_300MHz/ext_reset_in] [get_bd_pins proc_sys_reset_600MHz/ext_reset_in]
connect_bd_net [get_bd_pins audio_ss_0/irq_i2s_rx] [get_bd_pins xlconcat_0_0/In4]
connect_bd_net [get_bd_pins audio_ss_0/irq_i2s_tx] [get_bd_pins xlconcat_0_0/In5]
connect_bd_net [get_bd_pins audio_ss_0/irq_mm2s_audio] [get_bd_pins xlconcat_0_0/In7]
connect_bd_net -net audio_ss_0_irq_s2mm_audio_fmt [get_bd_pins audio_ss_0/irq_s2mm_audio] [get_bd_pins xlconcat_0_0/In6]
connect_bd_net [get_bd_pins audio_ss_0/lrclk_rx] [get_bd_ports lrclk_rx]
connect_bd_net -net audio_ss_0_lrclk_tx [get_bd_pins aura_m3_regs_0/servo_pwm] [get_bd_ports servo_pwm]
connect_bd_net [get_bd_pins audio_ss_0/mclk_out_rx] [get_bd_ports mclk_out_rx]
connect_bd_net [get_bd_pins audio_ss_0/mclk_out_tx] [get_bd_ports mclk_out_tx]
connect_bd_net [get_bd_pins audio_ss_0/sclk_rx] [get_bd_ports sclk_rx]
connect_bd_net [get_bd_pins audio_ss_0/sclk_tx] [get_bd_ports sclk_tx]
connect_bd_net [get_bd_pins audio_ss_0/sdata_tx] [get_bd_ports sdata_tx]
connect_bd_net [get_bd_pins axi_iic_0/iic2intc_irpt] [get_bd_pins xlconcat_0_0/In3]
connect_bd_net [get_bd_pins capture_pipeline/interrupt] [get_bd_pins xlconcat_0_0/In1]
connect_bd_net [get_bd_pins clk_wiz_0/clk_100M] \
  [get_bd_pins PS_0/maxihpm0_lpd_aclk] [get_bd_pins audio_ss_0/ACLK] [get_bd_pins aura_m3_regs_0/s_axi_aclk] \
  [get_bd_pins axi_ic_ctrl_100/ACLK] [get_bd_pins axi_ic_ctrl_100/M00_ACLK] [get_bd_pins axi_ic_ctrl_100/M01_ACLK] \
  [get_bd_pins axi_ic_ctrl_100/M02_ACLK] [get_bd_pins axi_ic_ctrl_100/M03_ACLK] [get_bd_pins axi_ic_ctrl_100/M04_ACLK] \
  [get_bd_pins axi_ic_ctrl_100/M05_ACLK] [get_bd_pins axi_ic_ctrl_100/M06_ACLK] [get_bd_pins axi_ic_ctrl_100/S00_ACLK] \
  [get_bd_pins axi_iic_0/s_axi_aclk] [get_bd_pins capture_pipeline/lite_aclk] \
  [get_bd_pins proc_sys_reset_100MHz/slowest_sync_clk] [get_bd_pins vcu/s_axi_lite_aclk]
connect_bd_net [get_bd_pins clk_wiz_0/clk_200M] [get_bd_pins capture_pipeline/dphy_clk_200M]
connect_bd_net [get_bd_pins clk_wiz_0/clk_300M] \
  [get_bd_pins DPUCZDX8G_1/aclk] [get_bd_pins PS_0/maxihpm0_fpd_aclk] [get_bd_pins PS_0/maxihpm1_fpd_aclk] \
  [get_bd_pins PS_0/saxi_lpd_aclk] [get_bd_pins PS_0/saxihp0_fpd_aclk] [get_bd_pins PS_0/saxihp1_fpd_aclk] \
  [get_bd_pins PS_0/saxihp2_fpd_aclk] [get_bd_pins PS_0/saxihp3_fpd_aclk] [get_bd_pins PS_0/saxihpc0_fpd_aclk] \
  [get_bd_pins PS_0/saxihpc1_fpd_aclk] [get_bd_pins audio_ss_0/m_axi_aclk] [get_bd_pins axi_ic_PS_0_S_AXI_HP1_FPD/ACLK] \
  [get_bd_pins axi_ic_PS_0_S_AXI_HP1_FPD/M00_ACLK] [get_bd_pins axi_ic_PS_0_S_AXI_HP1_FPD/S00_ACLK] \
  [get_bd_pins axi_ic_PS_0_S_AXI_HP3_FPD/ACLK] [get_bd_pins axi_ic_PS_0_S_AXI_HP3_FPD/M00_ACLK] \
  [get_bd_pins axi_ic_PS_0_S_AXI_HP3_FPD/S00_ACLK] [get_bd_pins axi_ic_PS_0_S_AXI_HPC1_FPD/ACLK] \
  [get_bd_pins axi_ic_PS_0_S_AXI_HPC1_FPD/M00_ACLK] [get_bd_pins axi_ic_PS_0_S_AXI_HPC1_FPD/S00_ACLK] \
  [get_bd_pins axi_ic_accel_ctrl/ACLK] [get_bd_pins axi_ic_accel_ctrl/M00_ACLK] [get_bd_pins axi_ic_accel_ctrl/M01_ACLK] \
  [get_bd_pins axi_ic_accel_ctrl/S00_ACLK] [get_bd_pins axi_ic_audio_mcu/ACLK] [get_bd_pins axi_ic_audio_mcu/M00_ACLK] \
  [get_bd_pins axi_ic_audio_mcu/S00_ACLK] [get_bd_pins axi_ic_audio_mcu/S01_ACLK] [get_bd_pins axi_ic_audio_mcu/S02_ACLK] \
  [get_bd_pins axi_ic_ctrl_300/ACLK] [get_bd_pins axi_ic_ctrl_300/M00_ACLK] [get_bd_pins axi_ic_ctrl_300/S00_ACLK] \
  [get_bd_pins axi_vip_0/aclk] [get_bd_pins capture_pipeline/aclk] [get_bd_pins proc_sys_reset_300MHz/slowest_sync_clk] \
  [get_bd_pins vcu/m_axi_dec_aclk]
connect_bd_net [get_bd_pins clk_wiz_0/clk_50M] [get_bd_pins vcu/pll_ref_clk]
connect_bd_net [get_bd_pins clk_wiz_0/clk_600M] [get_bd_pins DPUCZDX8G_1/ap_clk_2] [get_bd_pins proc_sys_reset_600MHz/slowest_sync_clk]
connect_bd_net [get_bd_pins irq_const_tieoff/dout] \
  [get_bd_pins PS_0_pl_ps_irq0_1_interrupt_concat/In0] [get_bd_pins PS_0_pl_ps_irq0_1_interrupt_concat/In2] \
  [get_bd_pins PS_0_pl_ps_irq0_1_interrupt_concat/In3] [get_bd_pins PS_0_pl_ps_irq0_1_interrupt_concat/In4] \
  [get_bd_pins PS_0_pl_ps_irq0_1_interrupt_concat/In5] [get_bd_pins PS_0_pl_ps_irq0_1_interrupt_concat/In6]
connect_bd_net -net mipi_csi2_rx_subsyst_0_csirxss_csi_irq [get_bd_pins capture_pipeline/csirxss_csi_irq] [get_bd_pins xlconcat_0_0/In0]
connect_bd_net -net pl_rst_1 [get_bd_pins PS_0/pl_resetn1] [get_bd_pins audio_ss_0/pl_rstn1]
connect_bd_net -net proc_sys_reset_1_interconnect_aresetn [get_bd_pins proc_sys_reset_300MHz/interconnect_aresetn] \
  [get_bd_pins axi_ic_accel_ctrl/ARESETN] [get_bd_pins axi_ic_audio_mcu/ARESETN] [get_bd_pins axi_ic_ctrl_300/ARESETN]
connect_bd_net -net proc_sys_reset_1_peripheral_aresetn [get_bd_pins proc_sys_reset_300MHz/peripheral_aresetn] \
  [get_bd_pins DPUCZDX8G_1/aresetn] [get_bd_pins audio_ss_0/m_axi_aresetn] [get_bd_pins axi_ic_PS_0_S_AXI_HP1_FPD/ARESETN] \
  [get_bd_pins axi_ic_PS_0_S_AXI_HP1_FPD/M00_ARESETN] [get_bd_pins axi_ic_PS_0_S_AXI_HP1_FPD/S00_ARESETN] \
  [get_bd_pins axi_ic_PS_0_S_AXI_HP3_FPD/ARESETN] [get_bd_pins axi_ic_PS_0_S_AXI_HP3_FPD/M00_ARESETN] \
  [get_bd_pins axi_ic_PS_0_S_AXI_HP3_FPD/S00_ARESETN] [get_bd_pins axi_ic_PS_0_S_AXI_HPC1_FPD/ARESETN] \
  [get_bd_pins axi_ic_PS_0_S_AXI_HPC1_FPD/M00_ARESETN] [get_bd_pins axi_ic_PS_0_S_AXI_HPC1_FPD/S00_ARESETN] \
  [get_bd_pins axi_ic_accel_ctrl/M00_ARESETN] [get_bd_pins axi_ic_accel_ctrl/M01_ARESETN] \
  [get_bd_pins axi_ic_accel_ctrl/S00_ARESETN] [get_bd_pins axi_ic_audio_mcu/M00_ARESETN] \
  [get_bd_pins axi_ic_audio_mcu/S00_ARESETN] [get_bd_pins axi_ic_audio_mcu/S01_ARESETN] \
  [get_bd_pins axi_ic_audio_mcu/S02_ARESETN] [get_bd_pins axi_ic_ctrl_300/M00_ARESETN] \
  [get_bd_pins axi_ic_ctrl_300/S00_ARESETN] [get_bd_pins axi_vip_0/aresetn] [get_bd_pins capture_pipeline/aresetn] \
  [get_bd_pins vcu/aresetn]
connect_bd_net -net proc_sys_reset_2_peripheral_aresetn [get_bd_pins proc_sys_reset_100MHz/peripheral_aresetn] \
  [get_bd_pins audio_ss_0/ARESETN] [get_bd_pins aura_m3_regs_0/s_axi_aresetn] [get_bd_pins axi_ic_ctrl_100/M00_ARESETN] \
  [get_bd_pins axi_ic_ctrl_100/M01_ARESETN] [get_bd_pins axi_ic_ctrl_100/M02_ARESETN] \
  [get_bd_pins axi_ic_ctrl_100/M03_ARESETN] [get_bd_pins axi_ic_ctrl_100/M04_ARESETN] \
  [get_bd_pins axi_ic_ctrl_100/M05_ARESETN] [get_bd_pins axi_ic_ctrl_100/M06_ARESETN] \
  [get_bd_pins axi_ic_ctrl_100/S00_ARESETN] [get_bd_pins axi_iic_0/s_axi_aresetn] [get_bd_pins capture_pipeline/lite_aresetn]
connect_bd_net [get_bd_pins proc_sys_reset_600MHz/peripheral_aresetn] [get_bd_pins DPUCZDX8G_1/ap_rst_n_2]
connect_bd_net -net sdata_rx_0_1 [get_bd_ports sdata_rx] [get_bd_pins audio_ss_0/sdata_rx]
connect_bd_net -net vcu_0_vcu_host_interrupt [get_bd_pins vcu/vcu_host_interrupt] [get_bd_pins xlconcat_0_0/In2]
connect_bd_net [get_bd_pins xlconcat_0_0/dout] [get_bd_pins PS_0/pl_ps_irq1]
connect_bd_net [get_bd_pins xlconstant_0/dout] [get_bd_ports ap1302_standby]
connect_bd_net [get_bd_pins xlslice_0/Dout] [get_bd_ports ap1302_rst_b]
connect_bd_net [get_bd_pins xlslice_ttc_0/Dout] [get_bd_ports fan_en_b]
connect_bd_net -net zynq_ultra_ps_e_0_emio_ttc0_wave_o [get_bd_pins PS_0/emio_ttc0_wave_o] [get_bd_pins xlslice_ttc_0/Din]
set_property HDL_ATTRIBUTE.aclk.FREQ_HZ 300000000 [get_bd_cells DPUCZDX8G_1]
set_property HDL_ATTRIBUTE.aclk.FREQ_HZ_TOLERANCE 15000000 [get_bd_cells DPUCZDX8G_1]
set_property HDL_ATTRIBUTE.ap_clk_2.FREQ_HZ 600000000 [get_bd_cells DPUCZDX8G_1]
set_property HDL_ATTRIBUTE.ap_clk_2.FREQ_HZ_TOLERANCE 30000000 [get_bd_cells DPUCZDX8G_1]
set_property HDL_ATTRIBUTE.saxihp1_fpd_aclk.FREQ_HZ 300000000 [get_bd_cells PS_0]
set_property HDL_ATTRIBUTE.saxihp1_fpd_aclk.FREQ_HZ_TOLERANCE 15000000 [get_bd_cells PS_0]
set_property HDL_ATTRIBUTE.saxihp3_fpd_aclk.FREQ_HZ 300000000 [get_bd_cells PS_0]
set_property HDL_ATTRIBUTE.saxihp3_fpd_aclk.FREQ_HZ_TOLERANCE 15000000 [get_bd_cells PS_0]
set_property HDL_ATTRIBUTE.saxihpc1_fpd_aclk.FREQ_HZ 300000000 [get_bd_cells PS_0]
set_property HDL_ATTRIBUTE.saxihpc1_fpd_aclk.FREQ_HZ_TOLERANCE 15000000 [get_bd_cells PS_0]
set_property PFM.AXI_PORT {M02_AXI { memport "M_AXI_GP" sptag "" memory "" } M03_AXI { memport "M_AXI_GP" sptag "" memory "" } M04_AXI { memport "M_AXI_GP" sptag "" memory "" } M05_AXI { memport "M_AXI_GP" sptag "" memory "" } M06_AXI { memport "M_AXI_GP" sptag "" memory "" } M07_AXI { memport "M_AXI_GP" sptag "" memory "" } M08_AXI { memport "M_AXI_GP" sptag "" memory "" } M09_AXI { memport "M_AXI_GP" sptag "" memory "" } M10_AXI { memport "M_AXI_GP" sptag "" memory "" } M11_AXI { memport "M_AXI_GP" sptag "" memory "" } M12_AXI { memport "M_AXI_GP" sptag "" memory "" } M13_AXI { memport "M_AXI_GP" sptag "" memory "" } M14_AXI { memport "M_AXI_GP" sptag "" memory "" } M15_AXI { memport "M_AXI_GP" sptag "" memory "" } } [get_bd_cells axi_ic_accel_ctrl]
set_property PFM.AXI_PORT {S03_AXI {memport "MIG" sptag "LPD" memory "PS_0 LPD_DDR_LOW" is_range "false"} S04_AXI {memport "MIG" sptag "LPD" memory "PS_0 LPD_DDR_LOW" is_range "false"} S05_AXI {memport "MIG" sptag "LPD" memory "PS_0 LPD_DDR_LOW" is_range "false"}} [get_bd_cells axi_ic_audio_mcu]
set_property PFM.CLOCK {clk_100M {id "2" is_default "false" proc_sys_reset "/proc_sys_reset_100MHz" status "fixed"} clk_300M {id "0" is_default "true" proc_sys_reset "/proc_sys_reset_300MHz" status "fixed"} clk_600M {id "1" is_default "false" proc_sys_reset "/proc_sys_reset_600MHz" status "fixed"}} [get_bd_cells clk_wiz_0]

# ---- address map ----
assign_bd_address -offset 0x0000000000 -range 2G -target_address_space [get_bd_addr_spaces audio_ss_0/m_axi_mm2s_audio] [get_bd_addr_segs PS_0/SAXIGP6/LPD_DDR_LOW]
assign_bd_address -offset 0x00C0000000 -range 512M -target_address_space [get_bd_addr_spaces audio_ss_0/m_axi_mm2s_audio] [get_bd_addr_segs PS_0/SAXIGP6/LPD_QSPI]
assign_bd_address -offset 0x00FF000000 -range 16M -target_address_space [get_bd_addr_spaces audio_ss_0/m_axi_mm2s_audio] [get_bd_addr_segs PS_0/SAXIGP6/LPD_LPS_OCM]
assign_bd_address -offset 0x0800000000 -range 32G -target_address_space [get_bd_addr_spaces audio_ss_0/m_axi_mm2s_audio] [get_bd_addr_segs PS_0/SAXIGP6/LPD_DDR_HIGH]
assign_bd_address -offset 0x0000000000 -range 2G -target_address_space [get_bd_addr_spaces audio_ss_0/m_axi_s2mm_audio] [get_bd_addr_segs PS_0/SAXIGP6/LPD_DDR_LOW]
assign_bd_address -offset 0x00C0000000 -range 512M -target_address_space [get_bd_addr_spaces audio_ss_0/m_axi_s2mm_audio] [get_bd_addr_segs PS_0/SAXIGP6/LPD_QSPI]
assign_bd_address -offset 0x00FF000000 -range 16M -target_address_space [get_bd_addr_spaces audio_ss_0/m_axi_s2mm_audio] [get_bd_addr_segs PS_0/SAXIGP6/LPD_LPS_OCM]
assign_bd_address -offset 0x0800000000 -range 32G -target_address_space [get_bd_addr_spaces audio_ss_0/m_axi_s2mm_audio] [get_bd_addr_segs PS_0/SAXIGP6/LPD_DDR_HIGH]
assign_bd_address -offset 0x00000000 -range 2G -target_address_space [get_bd_addr_spaces capture_pipeline/v_frmbuf_wr_0/Data_m_axi_mm_video] [get_bd_addr_segs PS_0/SAXIGP2/HP0_DDR_LOW]
assign_bd_address -offset 0xC0000000 -range 512M -target_address_space [get_bd_addr_spaces capture_pipeline/v_frmbuf_wr_0/Data_m_axi_mm_video] [get_bd_addr_segs PS_0/SAXIGP2/HP0_QSPI]
exclude_bd_addr_seg -offset 0xFF000000 -range 16M -target_address_space [get_bd_addr_spaces capture_pipeline/v_frmbuf_wr_0/Data_m_axi_mm_video] [get_bd_addr_segs PS_0/SAXIGP2/HP0_LPS_OCM]
exclude_bd_addr_seg -offset 0x800000000 -range 4G -target_address_space [get_bd_addr_spaces capture_pipeline/v_frmbuf_wr_0/Data_m_axi_mm_video] [get_bd_addr_segs PS_0/SAXIGP2/HP0_DDR_HIGH]
assign_bd_address -offset 0x0000000000 -range 2G -target_address_space [get_bd_addr_spaces DPUCZDX8G_1/M_AXI_GP0] [get_bd_addr_segs PS_0/SAXIGP1/HPC1_DDR_LOW]
assign_bd_address -offset 0x00C0000000 -range 512M -target_address_space [get_bd_addr_spaces DPUCZDX8G_1/M_AXI_GP0] [get_bd_addr_segs PS_0/SAXIGP1/HPC1_QSPI]
assign_bd_address -offset 0x00FF000000 -range 16M -target_address_space [get_bd_addr_spaces DPUCZDX8G_1/M_AXI_GP0] [get_bd_addr_segs PS_0/SAXIGP1/HPC1_LPS_OCM]
assign_bd_address -offset 0x0800000000 -range 32G -target_address_space [get_bd_addr_spaces DPUCZDX8G_1/M_AXI_GP0] [get_bd_addr_segs PS_0/SAXIGP1/HPC1_DDR_HIGH]
assign_bd_address -offset 0x0000000000 -range 2G -target_address_space [get_bd_addr_spaces DPUCZDX8G_1/M_AXI_HP0] [get_bd_addr_segs PS_0/SAXIGP3/HP1_DDR_LOW]
assign_bd_address -offset 0x00C0000000 -range 512M -target_address_space [get_bd_addr_spaces DPUCZDX8G_1/M_AXI_HP0] [get_bd_addr_segs PS_0/SAXIGP3/HP1_QSPI]
assign_bd_address -offset 0x00FF000000 -range 16M -target_address_space [get_bd_addr_spaces DPUCZDX8G_1/M_AXI_HP0] [get_bd_addr_segs PS_0/SAXIGP3/HP1_LPS_OCM]
assign_bd_address -offset 0x0800000000 -range 32G -target_address_space [get_bd_addr_spaces DPUCZDX8G_1/M_AXI_HP0] [get_bd_addr_segs PS_0/SAXIGP3/HP1_DDR_HIGH]
assign_bd_address -offset 0x0000000000 -range 2G -target_address_space [get_bd_addr_spaces DPUCZDX8G_1/M_AXI_HP2] [get_bd_addr_segs PS_0/SAXIGP5/HP3_DDR_LOW]
assign_bd_address -offset 0x00C0000000 -range 512M -target_address_space [get_bd_addr_spaces DPUCZDX8G_1/M_AXI_HP2] [get_bd_addr_segs PS_0/SAXIGP5/HP3_QSPI]
assign_bd_address -offset 0x00FF000000 -range 16M -target_address_space [get_bd_addr_spaces DPUCZDX8G_1/M_AXI_HP2] [get_bd_addr_segs PS_0/SAXIGP5/HP3_LPS_OCM]
assign_bd_address -offset 0x0800000000 -range 32G -target_address_space [get_bd_addr_spaces DPUCZDX8G_1/M_AXI_HP2] [get_bd_addr_segs PS_0/SAXIGP5/HP3_DDR_HIGH]
assign_bd_address -offset 0x0080000000 -range 8K -target_address_space [get_bd_addr_spaces PS_0/Data] [get_bd_addr_segs capture_pipeline/mipi_csi2_rx_subsyst_0/csirxss_s_axi/Reg]
assign_bd_address -offset 0x0080030000 -range 64K -target_address_space [get_bd_addr_spaces PS_0/Data] [get_bd_addr_segs axi_iic_0/S_AXI/Reg]
assign_bd_address -offset 0x0080040000 -range 64K -target_address_space [get_bd_addr_spaces PS_0/Data] [get_bd_addr_segs audio_ss_0/s_axi_lite_audio_fmt/reg0]
assign_bd_address -offset 0x0080060000 -range 64K -target_address_space [get_bd_addr_spaces PS_0/Data] [get_bd_addr_segs audio_ss_0/s_axi_ctrl_i2s_rx/reg0]
assign_bd_address -offset 0x0080070000 -range 64K -target_address_space [get_bd_addr_spaces PS_0/Data] [get_bd_addr_segs audio_ss_0/s_axi_ctrl_i2s_tx/reg0]
assign_bd_address -offset 0x0080080000 -range 4K -target_address_space [get_bd_addr_spaces PS_0/Data] [get_bd_addr_segs aura_m3_regs_0/S_AXI/reg0]
assign_bd_address -offset 0x0080100000 -range 1M -target_address_space [get_bd_addr_spaces PS_0/Data] [get_bd_addr_segs vcu/vcu_0/S_AXI_LITE/Reg]
assign_bd_address -offset 0x00A0000000 -range 64K -target_address_space [get_bd_addr_spaces PS_0/Data] [get_bd_addr_segs axi_vip_0/S_AXI/Reg]
assign_bd_address -offset 0x00A0010000 -range 4K -target_address_space [get_bd_addr_spaces PS_0/Data] [get_bd_addr_segs DPUCZDX8G_1/S_AXI_CONTROL/reg0]
assign_bd_address -offset 0x00B0010000 -range 64K -target_address_space [get_bd_addr_spaces PS_0/Data] [get_bd_addr_segs capture_pipeline/v_frmbuf_wr_0/s_axi_CTRL/Reg]
assign_bd_address -offset 0x00000000000 -range 2G -target_address_space [get_bd_addr_spaces vcu/vcu_0/Code] [get_bd_addr_segs PS_0/SAXIGP6/LPD_DDR_LOW]
assign_bd_address -offset 0x000C0000000 -range 512M -target_address_space [get_bd_addr_spaces vcu/vcu_0/Code] [get_bd_addr_segs PS_0/SAXIGP6/LPD_QSPI]
assign_bd_address -offset 0x000FF000000 -range 16M -target_address_space [get_bd_addr_spaces vcu/vcu_0/Code] [get_bd_addr_segs PS_0/SAXIGP6/LPD_LPS_OCM]
assign_bd_address -offset 0x00800000000 -range 32G -target_address_space [get_bd_addr_spaces vcu/vcu_0/Code] [get_bd_addr_segs PS_0/SAXIGP6/LPD_DDR_HIGH]
assign_bd_address -offset 0x00000000000 -range 2G -target_address_space [get_bd_addr_spaces vcu/vcu_0/DecData0] [get_bd_addr_segs PS_0/SAXIGP4/HP2_DDR_LOW]
assign_bd_address -offset 0x000C0000000 -range 512M -target_address_space [get_bd_addr_spaces vcu/vcu_0/DecData0] [get_bd_addr_segs PS_0/SAXIGP4/HP2_QSPI]
assign_bd_address -offset 0x000FF000000 -range 16M -target_address_space [get_bd_addr_spaces vcu/vcu_0/DecData0] [get_bd_addr_segs PS_0/SAXIGP4/HP2_LPS_OCM]
assign_bd_address -offset 0x00800000000 -range 32G -target_address_space [get_bd_addr_spaces vcu/vcu_0/DecData0] [get_bd_addr_segs PS_0/SAXIGP4/HP2_DDR_HIGH]
assign_bd_address -offset 0x00000000000 -range 2G -target_address_space [get_bd_addr_spaces vcu/vcu_0/DecData1] [get_bd_addr_segs PS_0/SAXIGP4/HP2_DDR_LOW]
assign_bd_address -offset 0x000C0000000 -range 512M -target_address_space [get_bd_addr_spaces vcu/vcu_0/DecData1] [get_bd_addr_segs PS_0/SAXIGP4/HP2_QSPI]
assign_bd_address -offset 0x000FF000000 -range 16M -target_address_space [get_bd_addr_spaces vcu/vcu_0/DecData1] [get_bd_addr_segs PS_0/SAXIGP4/HP2_LPS_OCM]
assign_bd_address -offset 0x00800000000 -range 32G -target_address_space [get_bd_addr_spaces vcu/vcu_0/DecData1] [get_bd_addr_segs PS_0/SAXIGP4/HP2_DDR_HIGH]
assign_bd_address -offset 0x00000000000 -range 2G -target_address_space [get_bd_addr_spaces vcu/vcu_0/EncData0] [get_bd_addr_segs PS_0/SAXIGP0/HPC0_DDR_LOW]
assign_bd_address -offset 0x000C0000000 -range 512M -target_address_space [get_bd_addr_spaces vcu/vcu_0/EncData0] [get_bd_addr_segs PS_0/SAXIGP0/HPC0_QSPI]
assign_bd_address -offset 0x000FF000000 -range 16M -target_address_space [get_bd_addr_spaces vcu/vcu_0/EncData0] [get_bd_addr_segs PS_0/SAXIGP0/HPC0_LPS_OCM]
assign_bd_address -offset 0x00800000000 -range 32G -target_address_space [get_bd_addr_spaces vcu/vcu_0/EncData0] [get_bd_addr_segs PS_0/SAXIGP0/HPC0_DDR_HIGH]
assign_bd_address -offset 0x00000000000 -range 2G -target_address_space [get_bd_addr_spaces vcu/vcu_0/EncData1] [get_bd_addr_segs PS_0/SAXIGP0/HPC0_DDR_LOW]
assign_bd_address -offset 0x000C0000000 -range 512M -target_address_space [get_bd_addr_spaces vcu/vcu_0/EncData1] [get_bd_addr_segs PS_0/SAXIGP0/HPC0_QSPI]
assign_bd_address -offset 0x000FF000000 -range 16M -target_address_space [get_bd_addr_spaces vcu/vcu_0/EncData1] [get_bd_addr_segs PS_0/SAXIGP0/HPC0_LPS_OCM]
assign_bd_address -offset 0x00800000000 -range 32G -target_address_space [get_bd_addr_spaces vcu/vcu_0/EncData1] [get_bd_addr_segs PS_0/SAXIGP0/HPC0_DDR_HIGH]

validate_bd_design
save_bd_design
